# Altium schematic sheet block_diagram.SchDoc
size 420 x 297 mm; SheetNumber: 2; SheetTotal: 5
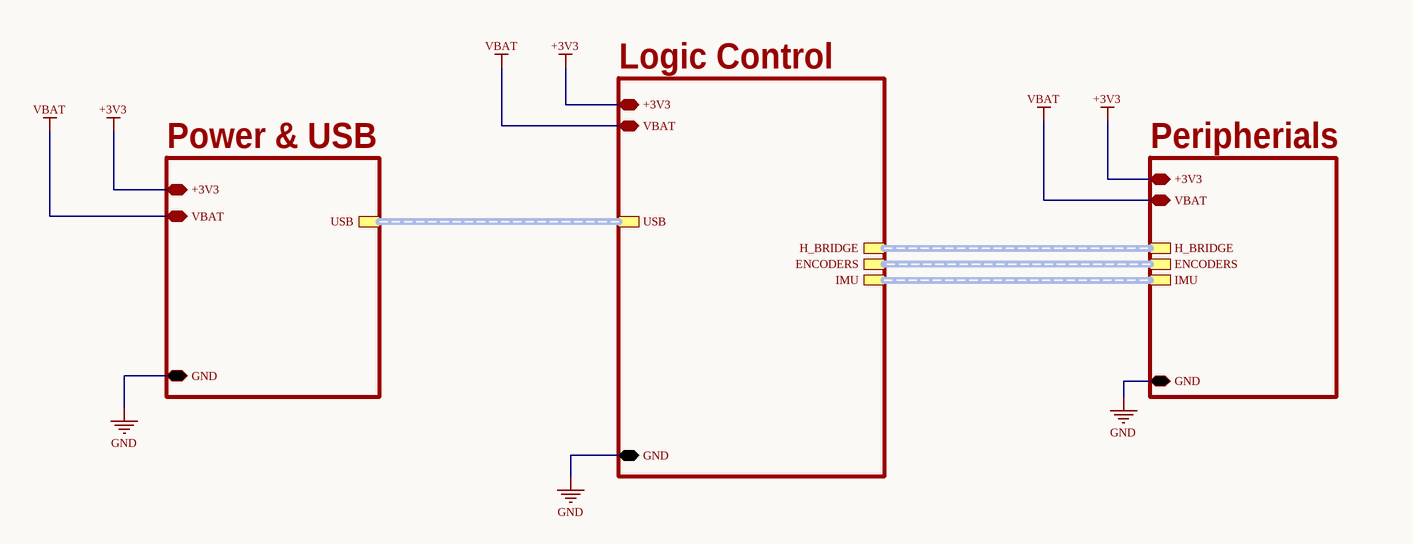
[diagram p0: block_diagram.SchDoc]

## Sub-sheets
Logic Control = logic_control.SchDoc: GND (bidir), USB (harness USB), +3V3 (bidir), VBAT (bidir), H_BRIDGE (harness H_BRIDGE), ENCODERS (harness ENCODERS), IMU (harness IMU)
Peripherials = peripherials.SchDoc: +3V3 (bidir), VBAT (bidir), GND (bidir), ENCODERS (harness ENCODERS), H_BRIDGE (harness H_BRIDGE), IMU (harness IMU)
Power & USB = power_supply.SchDoc: USB (harness USB), +3V3 (bidir), VBAT (bidir), GND (bidir)

## Nets
+3V3: sheet Power & USB/+3V3, sheet Logic Control/+3V3, sheet Peripherials/+3V3
GND: sheet Power & USB/GND, sheet Logic Control/GND, sheet Peripherials/GND
VBAT: sheet Power & USB/VBAT, sheet Logic Control/VBAT, sheet Peripherials/VBAT

## Buses and harness runs
harness sheet Logic Control/ENCODERS = sheet Peripherials/ENCODERS
harness sheet Logic Control/H_BRIDGE = sheet Peripherials/H_BRIDGE
harness sheet Logic Control/IMU = sheet Peripherials/IMU
harness sheet Logic Control/USB = sheet Power & USB/USB

## Notes on the sheet
- Título:
- Equipe de Robótica Titans
- Projeto:
- Autor:
- Número:
- Aprovado por:
- Revisão:
- Data:
- Última Modificação:
- Página
- De